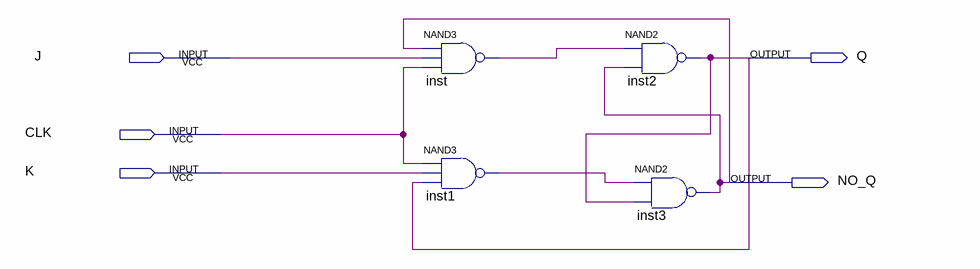
[diagram p0: schematic sheet]
// Quartus schematic flip_flop_JK.bdf as structural Verilog: 4 symbols, 5 pins
module flip_flop_JK (
  input  J,
  input  CLK,
  input  K,
  output Q,
  output NO_Q
);

  wire inst1_out, inst_out;

  nand inst (inst_out, NO_Q, J, CLK);
  nand inst1 (inst1_out, CLK, K, Q);
  nand inst2 (Q, inst_out, NO_Q);
  nand inst3 (NO_Q, inst1_out, Q);
endmodule
